# Altium schematic sheet Controller_Section.SchDoc
size A4; DocumentNumber: 6; SheetNumber: 6; SheetTotal: 8
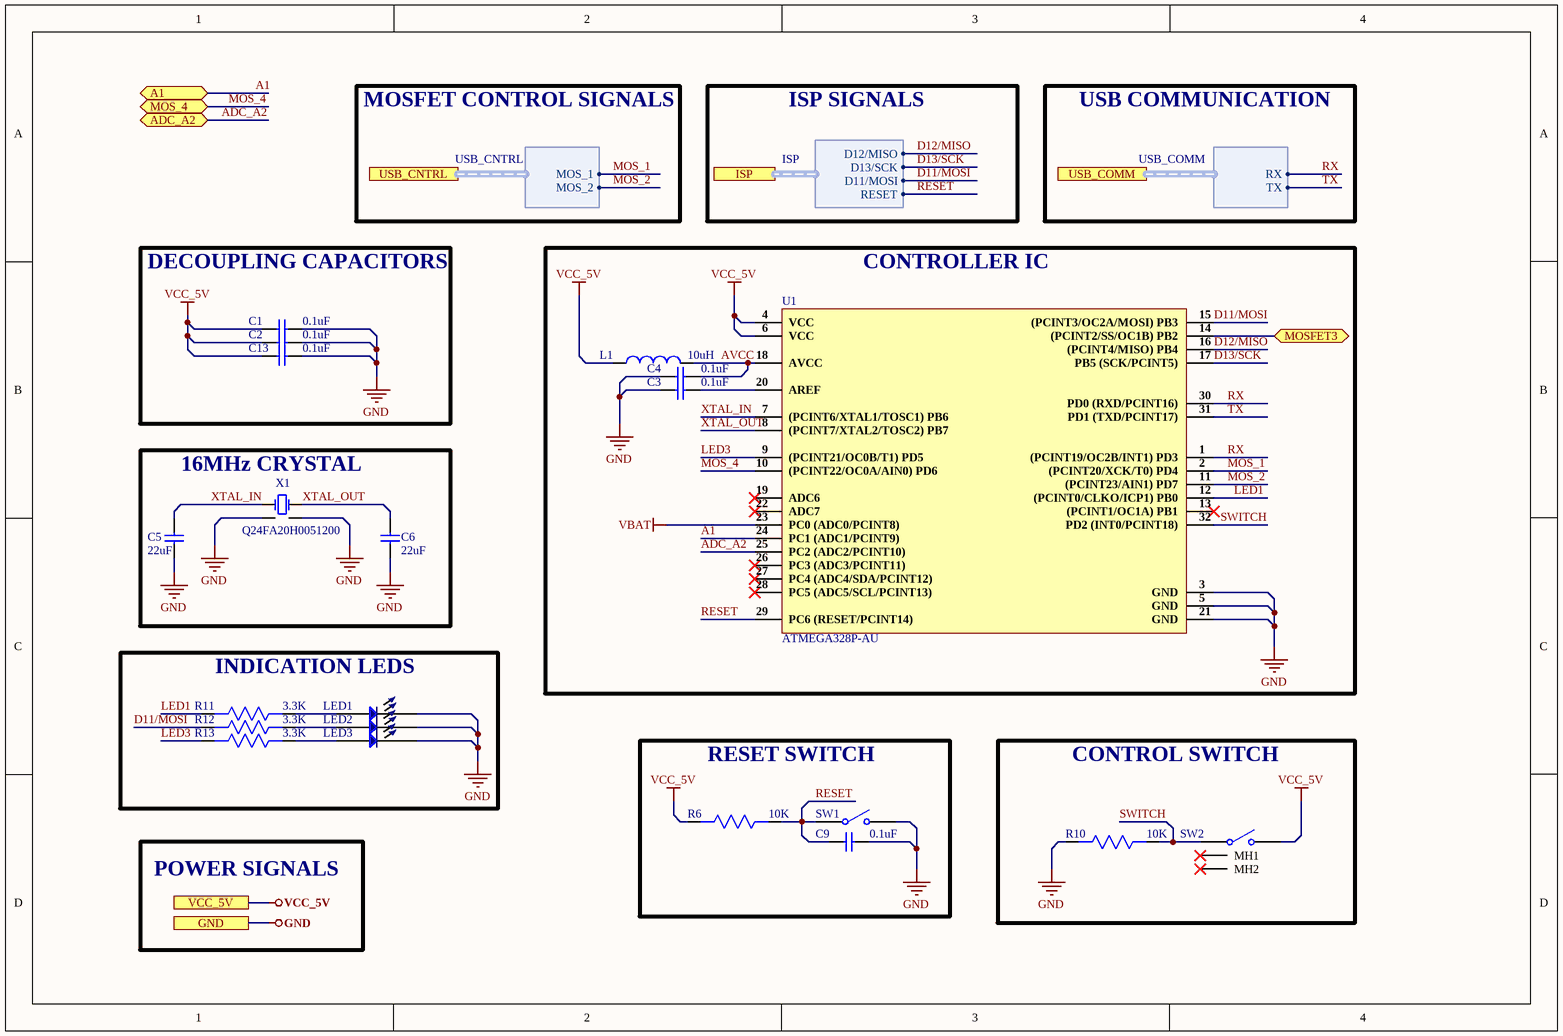
[diagram p0: Controller_Section.SchDoc]

## Parts
C1  0.1uF  [Cap0603]
C2  0.1uF  [Cap0603]
C3  0.1uF  [Cap0603]
C4  0.1uF  [Cap0603]
C5  22uF  [Cap0805]
C6  22uF  [Cap0805]
C9  0.1uF  [Cap0603]
C13  0.1uF  [Cap0603]
L1  10uH  [Ind0805]
LED1  L314GT  [TH-LED]  (value not drawn)
LED2  L314GT  [TH-LED]  (value not drawn)
LED3  L314GT  [TH-LED]  (value not drawn)
R6  10K  [Res0603]
R10  10K  [Res0603]
R11  3.3K  [Res0603]
R12  3.3K  [Res0603]
R13  3.3K  [Res0603]
SW1  TS-1185EC-C-D-B  [TS-1185EC-C-D-B]  (value not drawn)
SW2  SKHHLQA010  [SKHHLQA010]  (value not drawn)
U1  ATMEGA328P-AU  [32 TQFP (7X7)]
X1  Q24FA20H0051200  [Q24FA20H0051200]

## Blocks framed on the sheet
DECOUPLING CAPACITORS: C1 C2 C13
CONTROLLER IC: C3 C4 L1 U1
16MHz CRYSTAL: C5 C6 X1
INDICATION LEDS: LED1-LED3 R11-R13
RESET SWITCH: C9 R6 SW1
CONTROL SWITCH: R10 SW2

## Ports
A1 (bidir), ADC_A2 (bidir), GND, ISP (harness ISP), MOS_4 (bidir), MOSFET3 (bidir), USB_CNTRL (harness USB_CNTRL), USB_COMM (harness USB_COMM), VCC_5V

## Harnesses
ISP: D12/MISO, D13/SCK, D11/MOSI, RESET
USB_COMM: RX, TX
USB_CNTRL: MOS_1, MOS_2

## Nets
GND: C1.2 C2.2 C3.1 C4.1 C5.1 C6.1 C9.2 C13.2 LED1.1 LED2.1 LED3.1 R10.2 SW1.2 U1.3(GND) U1.5(GND) U1.21(GND) X1.2(GND) X1.4(GND) ; port GND
VBAT: U1.23(PC0_(ADC0/PCINT8))
VCC_5V: C1.1 C2.1 C13.1 L1.1 R6.2 SW2.2 U1.4(VCC) U1.6(VCC) ; port VCC_5V
A1: U1.24(PC1_(ADC1/PCINT9)) ; port A1
ADC_A2: U1.25(PC2_(ADC2/PCINT10)) ; port ADC_A2
AVCC: C4.2 L1.2 U1.18(AVCC)
D11/MOSI: R12.2 U1.15((PCINT3/OC2A/MOSI)_PB3) ; port ISP.D11/MOSI
D12/MISO: U1.16((PCINT4/MISO)_PB4) ; port ISP.D12/MISO
D13/SCK: U1.17(PB5_(SCK/PCINT5)) ; port ISP.D13/SCK
LED1: R11.2 U1.12((PCINT0/CLKO/ICP1)_PB0)
LED3: R13.2 U1.9((PCINT21/OC0B/T1)_PD5)
MOS_1: U1.2((PCINT20/XCK/T0)_PD4) ; port USB_CNTRL.MOS_1
MOS_2: U1.11((PCINT23/AIN1)_PD7) ; port USB_CNTRL.MOS_2
MOS_4: U1.10((PCINT22/OC0A/AIN0)_PD6) ; port MOS_4
MOSFET3: U1.14((PCINT2/SS/OC1B)_PB2) ; port MOSFET3
RESET: C9.1 R6.1 SW1.1 U1.29(PC6_(RESET/PCINT14)) ; port ISP.RESET
RX: U1.1((PCINT19/OC2B/INT1)_PD3) U1.30(PD0_(RXD/PCINT16)) ; port USB_COMM.RX
SWITCH: R10.1 SW2.1 U1.32(PD2_(INT0/PCINT18))
TX: U1.31(PD1_(TXD/PCINT17)) ; port USB_COMM.TX
XTAL_IN: C5.2 U1.7((PCINT6/XTAL1/TOSC1)_PB6) X1.1(OSC1)
XTAL_OUT: C6.2 U1.8((PCINT7/XTAL2/TOSC2)_PB7) X1.3(OSC2)
NetC3_2: C3.2 U1.20(AREF)
NetLED1_2: LED1.2 R11.1
NetLED2_2: LED2.2 R12.1
NetLED3_2: LED3.2 R13.1

Not connected (* = marked no-connect by the designer): SW2 MH1* MH2*; U1 13((PCINT1/OC1A)_PB1)* 19(ADC6)* 22(ADC7)* 26(PC3_(ADC3/PCINT11))* 27(PC4_(ADC4/SDA/PCINT12))* 28(PC5_(ADC5/SCL/PCINT13))*

## Notes on the sheet
- MOSFET CONTROL SIGNALS
- ISP SIGNALS
- USB COMMUNICATION
- POWER SIGNALS

## Library data of the parts
C1-C4 C9 C13 = CC0603ZRY5V9BB104: CAP CER 0.1UF 50V Y5V 0603; Manufacturer: Yageo; Capacitance: 100nF; Tolerance: 80%; Supplier 1: Digi-Key; Manufacturer Part Number: CC0603ZRY5V9BB104; Stock 1: 15000880; Pricing 1: 1=0.1, 10=0.075, 100=0.0334, 500=0.02386, 1000=0.01874 (USD); Mount: Surface Mount; Case/Package: 0603; Number of Pins: 2; Case Code (Metric): 1608; Case Code (Imperial): 0603; Min Operating Temperature: -30°C; Max Operating Temperature: 85°C; Dielectric: Y5V; Voltage Rating: 50V; Package Quantity: 1; Packaging: Tape and Reel; Voltage Rating (DC): 50V; Termination: SMD/SMT; Composition: Ceramic; Voltage: 50V; Length: 1.6mm; Height: 0.8mm; Width: 0.031inch; Thickness: 0.035inch; Depth: 0.8mm; Radiation Hardening: No; REACH SVHC: No SVHC; Lead Free: Lead Free; Halogen Free: Halogen Free; ComponentLink1URL: http://www.yageo.com/documents/recent/UPY-GPHC_Y5V_6.3V-to-50V_8.pdf?src-supplier=Digi-Key; ComponentLink1Description: http://www.yageo.com/documents/recent/UPY-GPHC_Y5V_6.3V-to-50V_8.pdf?src-supplier=Digi-Key; ComponentLink2URL: http://www.yageo.com/documents/recent/UPY-GPHC_Y5V_6.3V-to-50V_5.pdf?src-supplier=Avnet+Europe; ComponentLink2Description: http://www.yageo.com/documents/recent/UPY-GPHC_Y5V_6.3V-to-50V_5.pdf?src-supplier=Avnet+Europe; ComponentLink3URL: https://www.verical.com/server-webapp/html/getDatasheet?partID=403611&src-supplier=Verical; ComponentLink3Description: https://www.verical.com/server-webapp/html/getDatasheet?partID=403611&src-supplier=Verical; ComponentLink4URL: http://www.mouser.com/ds/2/447/Yageo_UPY-GP_NP0_16V-to-50V_9-358835.pdf?src-supplier=Mouser; ComponentLink4Description: http://www.mouser.com/ds/2/447/Yageo_UPY-GP_NP0_16V-to-50V_9-358835.pdf?src-supplier=Mouser; ComponentLink5URL: http://www.farnell.com/datasheets/1132289.pdf?src-supplier=Element14; ComponentLink5Description: http://www.farnell.com/datasheets/1132289.pdf?src-supplier=Element14; Supplier Part Number 1: 311-1343-1-ND
C5 C6 = C2012X5R1V226MT000E: CAP CER 22UF 35V X5R 0805
L1 = MGFL2012F100MT-LF: 500mA 10uH ±20% 320mΩ 0805 Inductors; Manufacturer: Microgate; Manufacturer Part No:: MGFL2012F100MT-LF; Value: 10uH; Package: 0805; ComponentLink1Description: New link; ComponentLink1URL: https://lcsc.com/product-detail/Inductors-SMD_microgate-MGFL2012F100MT-LF_C281113.html
LED1-LED3 = L314GT: Green - LED Indication - Discrete 2.1V Radial; Manufacturer: American Opto Plus LED; Manufacturer Part No:: L314GT; Package: Custom; ComponentLink1Description: New link; ComponentLink1URL: https://www.digikey.com/en/products/detail/american-opto-plus-led/L314GT/13165175
R6 R10 = AC0603JR-0710KL: RES SMD 10K OHM 5% 1/10W 0603; Manufacturer: Yageo; Voltage Rating: 50V; Resistance: 10kR; Power Rating: 100mW; Temperature Coefficient: 100ppm/°C; Supplier 1: Future Electronics; Manufacturer Part Number: AC0603JR-0710KL; RoHS: Yes; Category: Chip SMD Resistors; Stock 1: 1533000; Pricing 1: 5000=0.00540 (USD); Case/Package: 0603; Case Code (Imperial): 0603; Case Code (Metric): 1608; Size Code: 0603; Min Operating Temperature: -55°C; Max Operating Temperature: 155°C; Packaging: Tape and Reel; Tolerance: 5%; Package Quantity: 1; Resistor Type: Thick Film; Termination: SMD/SMT; Number of Terminations: 2; Max Power Dissipation: 100mW; Features: Moisture Resistant,Automotive AEC-Q200,Anti-Sulfur; Series: AC; Construction: Rectangular; Length: 0.063inch; Width: 0.031inch; Height: 0.022inch; Depth: 0.8mm; Military Standard: Not; Lead Free: Lead Free; RoHS Compliant: Yes; ComponentLink1URL: https://datasheet.ciiva.com/5562/pyu-ac-51-rohs-l-2-5562553.pdf?src-supplier=Mouser; ComponentLink1Description: https://datasheet.ciiva.com/5562/pyu-ac-51-rohs-l-2-5562553.pdf?src-supplier=Mouser; Supplier Part Number 1: 1029044
R11-R13 = RC0603FR-073K3L: RES SMD 3.3K OHM 1% 1/10W 0603; Manufacturer: Yageo Phycomp; Temperature Coefficient: 100ppm/°C; Resistance: 3.3kR; Voltage Rating (DC): 50V; Power Rating: 100mW; Supplier 1: Digi-Key; Manufacturer Part Number: RC0603FR-073K3L; Stock 1: 6863000; Pricing 1: 1=0.1, 10=0.024, 100=0.0097, 1000=0.00437, 2500=0.00379 (USD); Mount: Surface Mount; Case/Package: 0603; Number of Pins: 2; Min Operating Temperature: -55°C; Max Operating Temperature: 155°C; Tolerance: 1%; Packaging: Cut Tape; Length: 1.6mm; Height: 0.45mm; Width: 800um; Depth: 0.8mm; REACH SVHC: No SVHC; Lead Free: Lead Free; Supplier Part Number 1: 311-3.30KHRCT-ND
SW1 = TS-1185EC-C-D-B: 3mm 2mm Round Button 50mA Top3.65mm SPST 12V SMD Tactile Switches; Manufacturer: XKB; Manufacturer Part No: TS-1185EC-C-D-B; Package: Custom; ComponentLink1Description: LCSC; ComponentLink1URL: https://lcsc.com/product-detail/Tactile-Switches_XKB-Connectivity-TS-1185EC-C-D-B_C318893.html
SW2 = SKHHLQA010: 6mm 8.35mm Round Button 50mA 6mm SPST 12V Plugin Tactile Switches; Manufacturer: ALPSALPINE; Manufacturer Part No: SKHHLQA010; Package: Custom; ComponentLink1Description: LCSC; ComponentLink1URL: https://lcsc.com/product-detail/Tactile-Switches_ALPSALPINE-SKHHLQA010_C125034.html
U1 = ATMEGA328P-AU: IC MCU 8BIT 32KB FLASH 32TQFP; Manufacturer: Microchip / Atmel; Frequency: 20MHz; Interface: I2C,SPI,USART; Number of I/Os: 23; Oscillator Type: Internal; Peripherals: Brown-out Detect/Reset,POR,PWM,WDT; Core Architecture: AVR; RAM Size: 2KB; Max Supply Voltage: 5.5V; Min Supply Voltage: 1.8V; Number of Timers/Counters: 3; Data Bus Width: 8b; Watchdog Timer: Yes; Number of ADC Channels: 8; Number of PWM Channels: 6; Number of SPI Channels: 1; Supplier 1: Newark; Manufacturer Part Number: ATMEGA328P-AU; RoHS: Yes; Category: Microcontrollers; Mount: Surface Mount; Case/Package: A; Number of Pins: 32; Weight: 0.002469oz; Min Operating Temperature: -40°C; Max Operating Temperature: 85°C; Packaging: Tray; Memory Type: FLASH; Memory Size: 32KB; Package Quantity: 250; Number of Programmable I/O: 23; Max Frequency: 20MHz; Series: ATmega328P; Number of I2C Channels: 1; Length: 7mm; Width: 7mm; Height: 1mm; Radiation Hardening: No; RoHS Compliant: Yes; REACH SVHC: No SVHC; Lead Free: Lead Free; ComponentLink1URL: https://datasheet.ciiva.com/1166/doc8161-1166860.pdf?src-supplier=Newark; ComponentLink1Description: https://datasheet.ciiva.com/1166/doc8161-1166860.pdf?src-supplier=Newark; ComponentLink2URL: https://datasheet.ciiva.com/29119/155196-da-01-en-microcontr-atmega328p-au-8bit-tqfp-32-29119594.pdf?src-supplier=Conrad; ComponentLink2Description: https://datasheet.ciiva.com/29119/155196-da-01-en-microcontr-atmega328p-au-8bit-tqfp-32-29119594.pdf?src-supplier=Conrad; ComponentLink3URL: https://datasheet.ciiva.com/1157/1693866-1157693.pdf?src-supplier=Element14; ComponentLink3Description: https://datasheet.ciiva.com/1157/1693866-1157693.pdf?src-supplier=Element14; ComponentLink4URL: https://datasheet.ciiva.com/15213/getdatasheetpartid-365828-15213131.pdf?src-supplier=Verical; ComponentLink4Description: https://datasheet.ciiva.com/15213/getdatasheetpartid-365828-15213131.pdf?src-supplier=Verical; Supplier Part Number 1: 25AC6140
X1 = Q24FA20H0051200: 16MHz SMD Crystal Resonator 10pF 80Ω ±10ppm; Manufacturer: Seiko Epson; Frequency: 16MHz; Crystal Type: SMD Crystal; Load Capacitance: 10pF; Equivalent Series Resistance (ESR): 80Ω; Frequency Tolerance: ±10ppm; Operating Temperature: -40℃~+85℃